# EasyEDA Pro project honglin-first_crt_smartphone-e4cb491d.epro, schematic Schematic1
Create Date: 2023-12-02; Page Name: P1; Project Name: 世界上第一台显像管安卓手机; Schematic Name: Schematic1; Update Date: 2023-12-02; Company: 嘉立创EDA; Page Size: A4; Version: V1.0
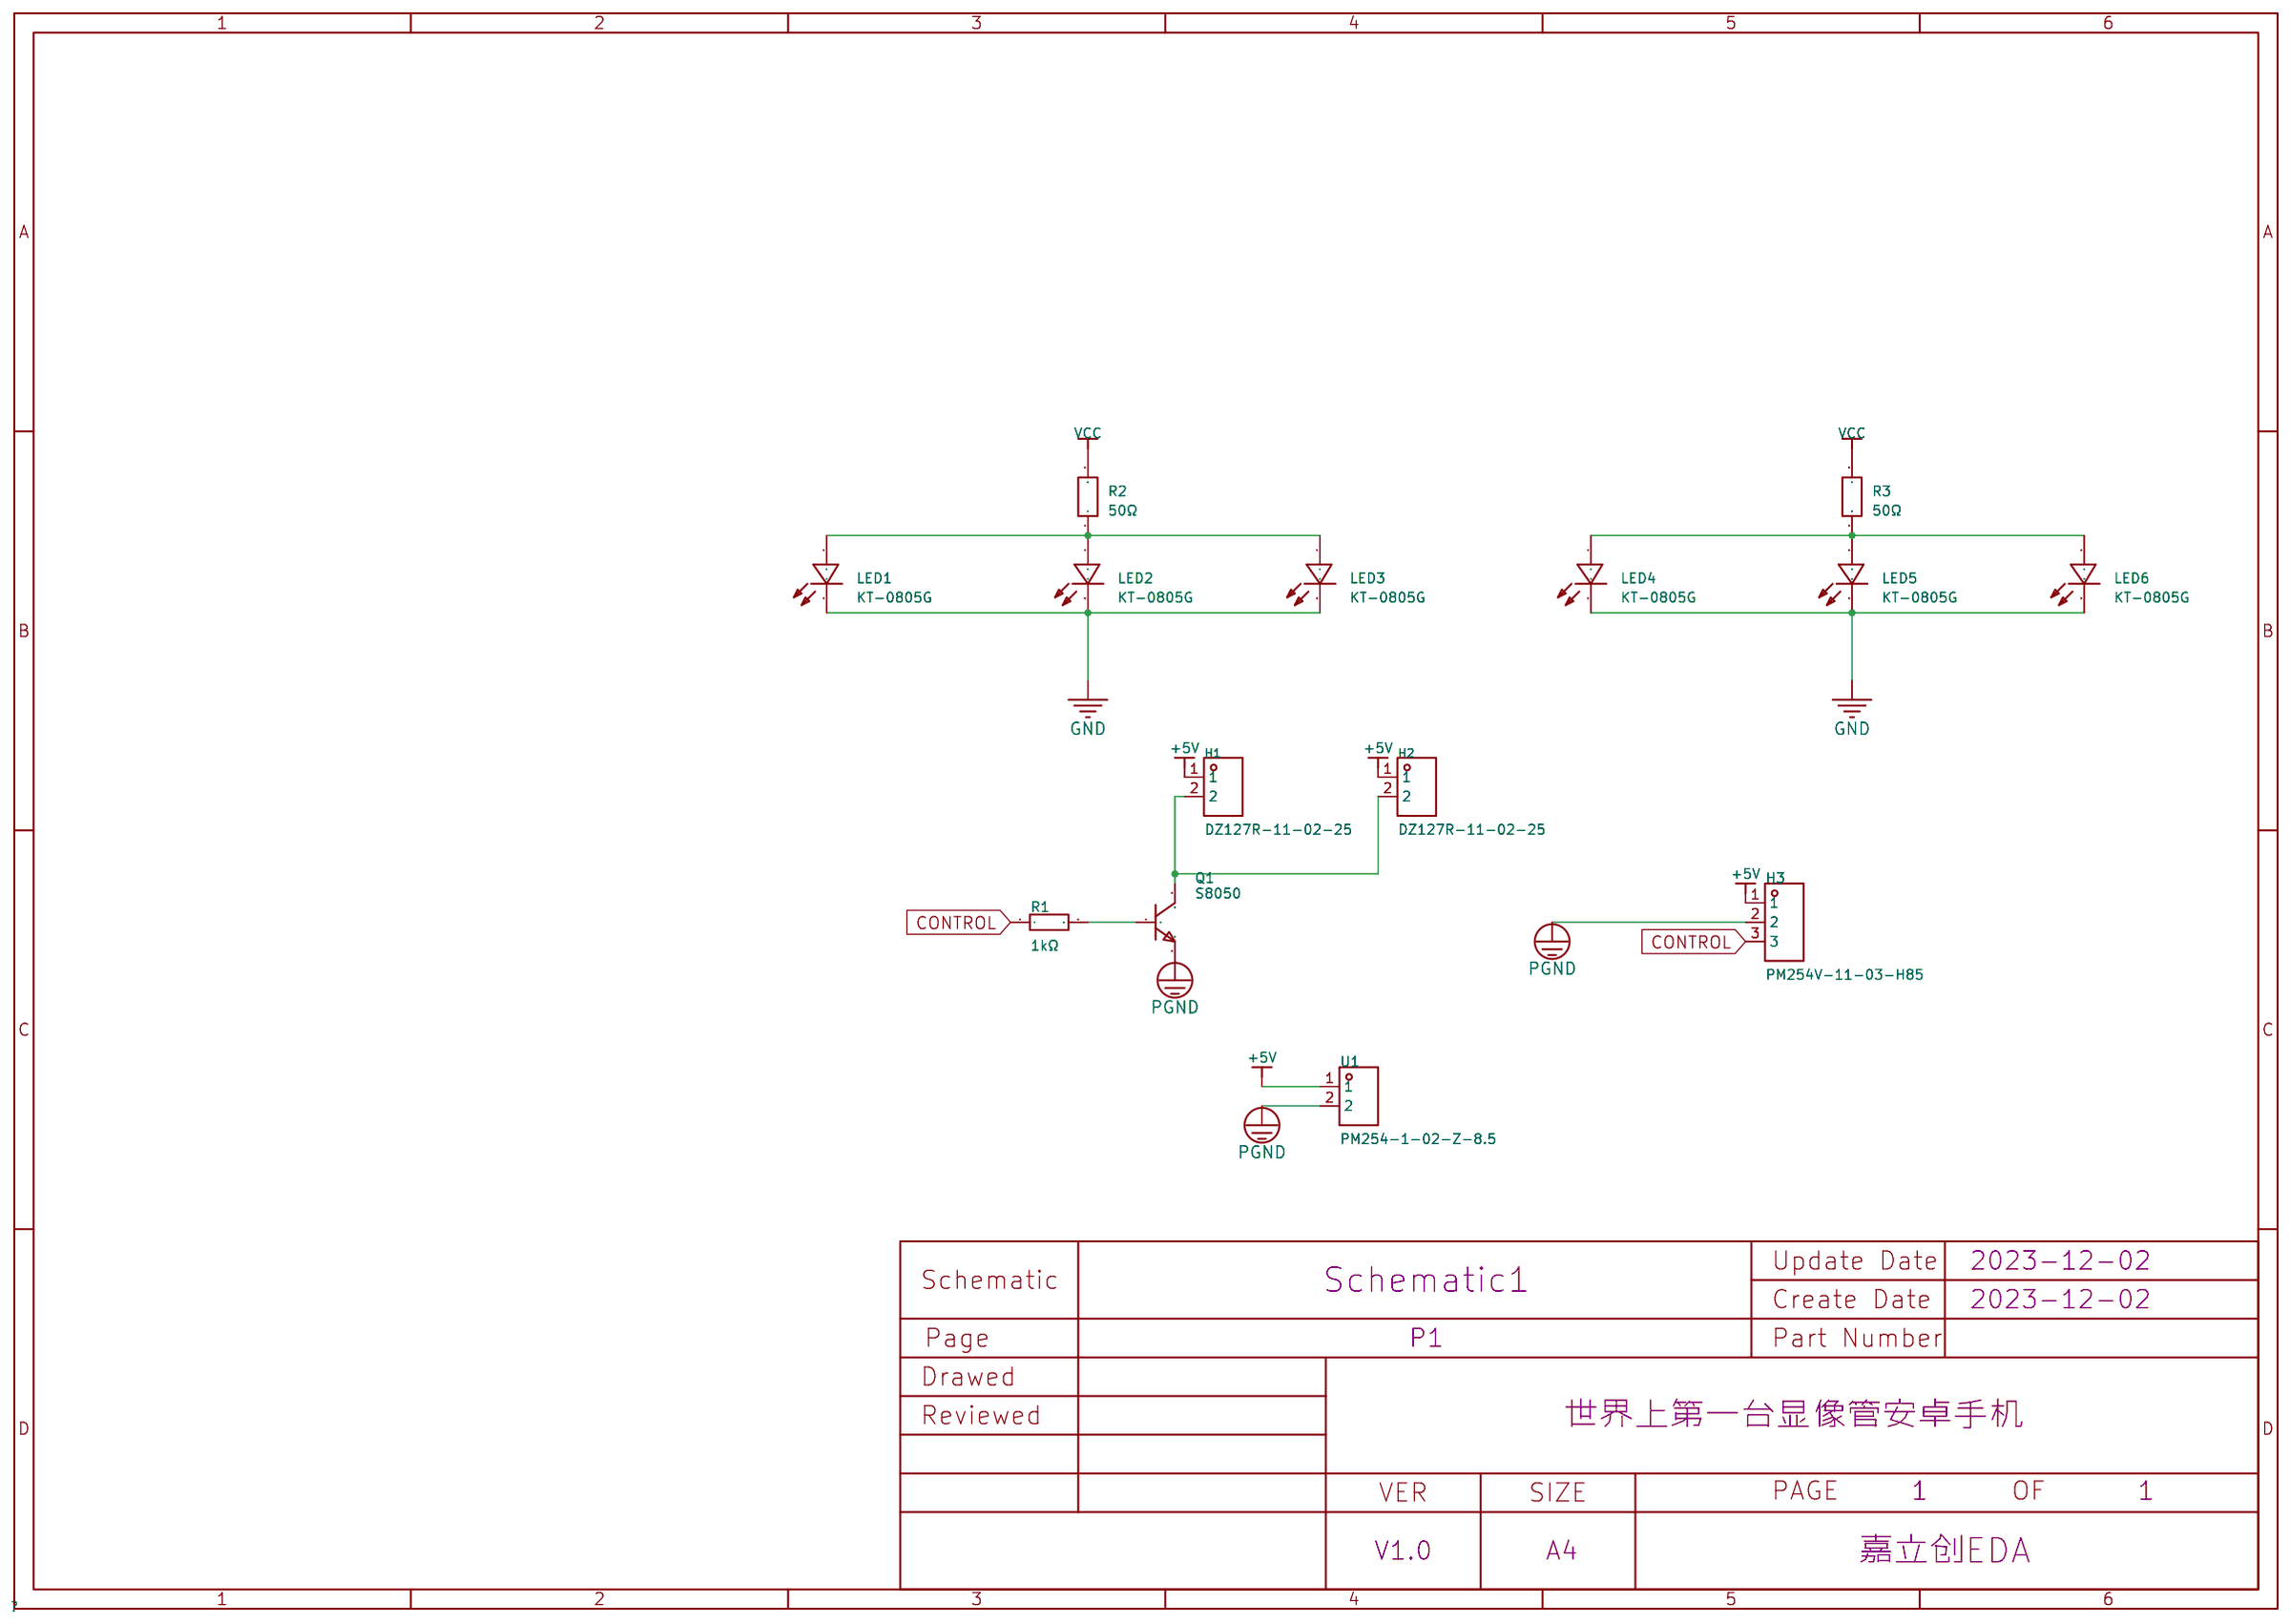
[diagram p5: schematic sheet]

## Parts
H1  DZ127R-11-02-25  [HDR-TH_2P-P1.27-V-M]
H2  DZ127R-11-02-25  [HDR-TH_2P-P1.27-V-M]
H3  PM254V-11-03-H85  [HDR-TH_3P-P2.54-V-F]
LED1  KT-0805G  [LED0805-R-RD]
LED2  KT-0805G  [LED0805-R-RD]
LED3  KT-0805G  [LED0805-R-RD]
LED4  KT-0805G  [LED0805-R-RD]
LED5  KT-0805G  [LED0805-R-RD]
LED6  KT-0805G  [LED0805-R-RD]
Q1  S8050  [SOT-23-3_L2.9-W1.3-P1.90-LS2.4-BR]
R1  1kΩ  [R0603]
R2  50Ω  [R0805]
R3  50Ω  [R0805]
U1  PM254-1-02-Z-8.5  [HDR-TH_2P-P2.54-V-F]

## Library data of the parts
H1 H2 = DZ127R-11-02-25: 排数:单排;总PIN位数:2;间距:1.27mm;插针结构:1x2P;行距:-;安装类型:直插;圆针/方针:方针;额定电流:1A;额定电压:-;配合针长度:3mm;塑高:1mm;端接针长度:2.5mm;工作温度范围:-;颜色:-;; LCSC Part Name: 1.27mm 1x2P 直插 方针; Supplier Part: C2935942; Manufacturer: DEALON(德艺隆); Supplier Footprint: 直插,P=1.27mm; Supplier: LCSC; Number of Rows: 单排; Number of Pins: 2; Pitch: 1.27mm; Pin Structure: 1x2P; Mounting Type: 直插; Circluar Pins/Square Pins: 方针; Current Rating (Max): 1A; Length of Mating Pin: 3mm; Insulation Height: 1mm; Length of End Connection Pin: 2.5mm
H3 = PM254V-11-03-H85: 排数:单排;总孔位数:3P;间距:2.54mm;插孔结构:1x3P;行距:-;安装类型:直插;塑高:-;触头材质:黄铜;触头镀层:-;; LCSC Part Name: 间距:2.54mm 1x3P 直插; Supplier Part: C541850; Manufacturer: XFCN(兴飞); Supplier Footprint: 插件,P=2.54mm; Datasheet: https://atta.szlcsc.com/upload/public/pdf/source/20200518/C541849_85853D71FC67C51915A806977A588FDA.pdf; Supplier: LCSC; Number of Rows: 单排; Number of Holes: 3P; Pitch: 2.54mm; Holes Structure: 1x3P; Mounting Type: 直插; Contact Material: 黄铜
LED1-LED6 = KT-0805G: 发光颜色:翠绿色;二极管配置:-;功率:-;透镜颜色:-;主波长:-;色温:-;发光强度:-;发光角度:-;安装方式:-;工作温度:-;; LCSC Part Name: 0805 翠绿 高亮; Supplier Part: C2297; Manufacturer: KENTO; Supplier Footprint: 0805; JLCPCB Part Class: 基础库; Datasheet: https://atta.szlcsc.com/upload/public/pdf/source/20170209/1486607340485.pdf; Supplier: LCSC; Emitted Color: 翠绿色
Q1 = S8050_C2891804: 功率(Pd):300mW;集射极击穿电压(Vceo):25V;集电极电流(Ic):500mA;晶体管类型:NPN;; LCSC Part Name: 耐压:25V 电流:500mA NPN; Supplier Part: C2891804; Manufacturer: YONGYUTAI(永裕泰); Supplier Footprint: SOT-23; Datasheet: https://atta.szlcsc.com/upload/public/pdf/source/20210901/5347316A10609C628D4D69AE01446E5B.pdf; Supplier: LCSC; Power Dissipation (Pd): 300mW; Collector-Emitter Breakdown Voltage (Vceo): 25V; Collector Current (Ic): 500mA; Collector Cut-Off Current (Icbo): 1uA; Collector-Emitter Saturation Voltage (VCE(sat)@Ic,Ib): 500mV@500mA,50mA; Transistor Type: NPN; Operating Temperature: +150℃@(Tj)
R1 = 0603WAF1001T5E: 阻值:1kΩ;精度:±1%;功率:100mW;温度系数:±100ppm/℃;电阻类型:厚膜电阻;; LCSC Part Name: 1kΩ ±1% 100mW 厚膜电阻; Supplier Part: C21190; Manufacturer: UNI-ROYAL(厚声); Supplier Footprint: 0603; Datasheet: https://atta.szlcsc.com/upload/public/pdf/source/20200306/C422600_1E6D84923E4A46A82E41ADD87F860B5C.pdf; Supplier: LCSC; Tolerance: ±1%; Power(Watts): 100mW; Overload Voltage (Max): 75V; Temperature Coefficient: ±100ppm/℃; Type: 厚膜电阻; Operating Temperature Range: -55℃~+155℃
R2 R3 = ARG05FTC0500: 电阻类型:薄膜电阻;阻值:50Ω;精度:±1%;功率:125mW;; LCSC Part Name: 50Ω ±1% 125mW; Supplier Part: C2828866; Manufacturer: Viking(光颉); Supplier Footprint: 0805; Datasheet: https://atta.szlcsc.com/upload/public/pdf/source/20211009/C2828866_809B0A4B7F0CCF94AC553FDFABB73F0E.pdf; Supplier: LCSC; Type: 薄膜电阻; Tolerance: ±1%; Power(Watts): 125mW; Temperature Coefficient: ±25ppm/℃; Overload Voltage (Max): 150V; Operating Temperature Range: -55℃~+155℃
U1 = PM254-1-02-Z-8.5: 插孔结构:1x2P;间距:2.54mm;总孔位数:2P;安装类型:直插;排数:单排;行距:-;圆孔/方孔:方孔;额定电流:3A;额定电压:-;插孔方向:顶部;塑高:8.5mm;工作温度范围:-40℃~+105℃;; LCSC Part Name: 间距:2.54mm 1x2P 直插; Supplier Part: C2897365; Manufacturer: HCTL(华灿天禄); Supplier Footprint: 插件,P=2.54mm; Datasheet: https://atta.szlcsc.com/upload/public/pdf/source/20230609/534BE42964C679BDE98E061007C4ABD6.pdf; Supplier: LCSC; Holes Structure: 1x2P; Pitch: 2.54mm; Number of Holes: 2P; Mounting Type: 直插; Number of Rows: 单排; Circular Hole / Square Hole: 方孔; Current Rating (Max): 3A; Holes Direction: 顶部; Insulation Height: 8.5mm; Operating Temperature Range: -40℃~+105℃

## Nets
+5V: H1.1 H2.1 H3.1 U1.1
GND: LED1.2(K) LED2.2(K) LED3.2(K) LED4.2(K) LED5.2(K) LED6.2(K)
PGND: H3.2 Q1.2(E) U1.2
VCC: R2.2 R3.2
CONTROL: H3.3 R1.1
$1N371: Q1.1(B) R1.2
$1N727: LED4.1(A) LED5.1(A) LED6.1(A) R3.1
$1N876: H1.2 H2.2 Q1.3(C)
Net-(LED1-1): LED1.1(A) LED2.1(A) LED3.1(A) R2.1
